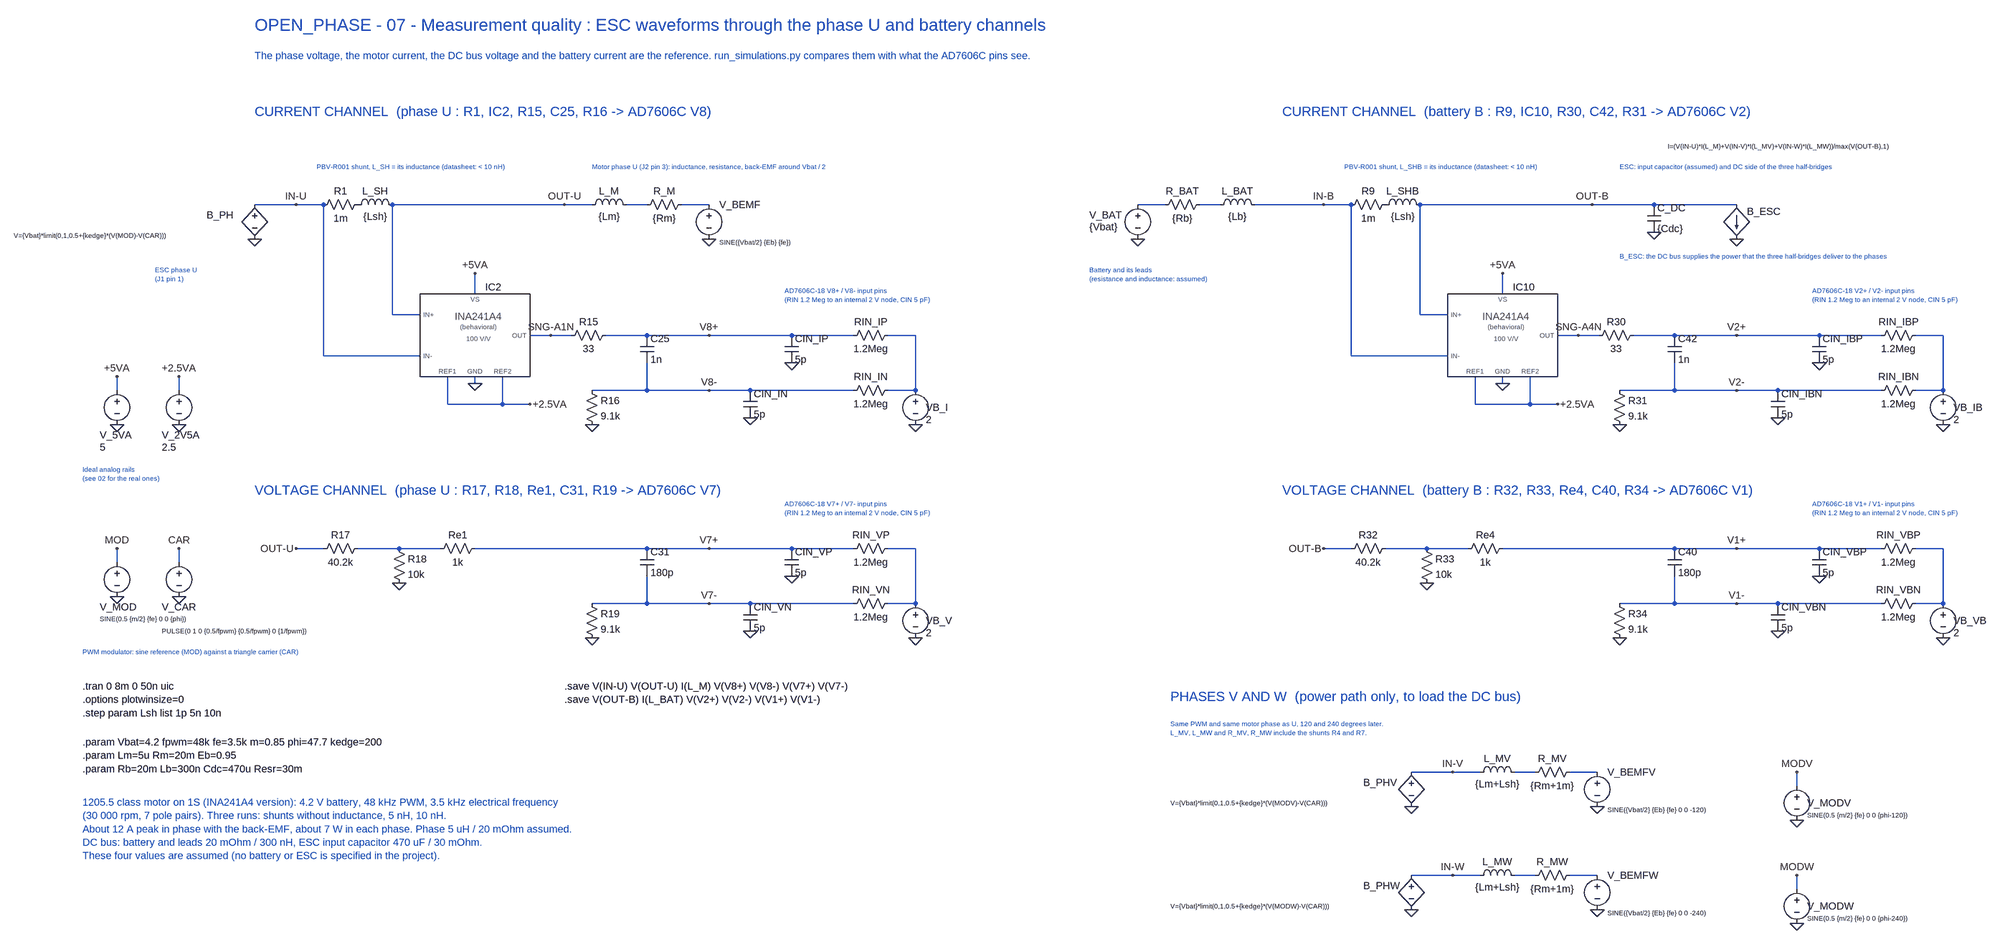
[diagram p0: schematic 07_Measurement_Quality_Waveforms.asc]
07_Measurement_Quality_Waveforms.asc, the LTspice schematic file:
Version 4
SHEET 1 4700 1900
WIRE 0 0 96 0
WIRE 96 0 160 0
WIRE 320 0 720 0
WIRE 720 0 784 0
WIRE 864 0 912 0
WIRE 992 0 1056 0
WIRE 320 0 320 256
WIRE 320 256 384 256
WIRE 160 0 160 352
WIRE 160 352 384 352
WIRE 512 208 512 160
WIRE 512 400 512 416
WIRE 448 400 448 464
WIRE 448 464 576 464
WIRE 576 464 576 400
WIRE 576 464 640 464
WIRE 640 304 688 304
WIRE 688 304 736 304
WIRE 912 368 912 432
WIRE 1472 304 1536 304
WIRE 1536 304 1536 432
WIRE 1472 432 1536 432
WIRE 816 304 912 304
WIRE 912 304 1056 304
WIRE 1056 304 1248 304
WIRE 1248 304 1392 304
WIRE 784 432 912 432
WIRE 912 432 1056 432
WIRE 1056 432 1152 432
WIRE 1152 432 1392 432
WIRE 96 800 160 800
WIRE 240 800 336 800
WIRE 336 800 432 800
WIRE 912 864 912 928
WIRE 1472 800 1536 800
WIRE 1536 800 1536 928
WIRE 1472 928 1536 928
WIRE 512 800 912 800
WIRE 912 800 1056 800
WIRE 1056 800 1248 800
WIRE 1248 800 1392 800
WIRE 784 928 912 928
WIRE 912 928 1056 928
WIRE 1056 928 1152 928
WIRE 1152 928 1392 928
WIRE -320 432 -320 400
WIRE -176 432 -176 400
WIRE 2464 0 2528 0
WIRE 2608 0 2656 0
WIRE 2736 0 2800 0
WIRE 2800 0 2896 0
WIRE 2896 0 2960 0
WIRE 3120 0 3520 0
WIRE 3520 0 3664 0
WIRE 3664 0 3856 0
WIRE 3120 0 3120 256
WIRE 3120 256 3184 256
WIRE 2960 0 2960 352
WIRE 2960 352 3184 352
WIRE 3312 208 3312 160
WIRE 3312 400 3312 416
WIRE 3248 400 3248 464
WIRE 3248 464 3376 464
WIRE 3376 464 3376 400
WIRE 3376 464 3440 464
WIRE 3440 304 3488 304
WIRE 3488 304 3536 304
WIRE 3712 368 3712 432
WIRE 4272 304 4336 304
WIRE 4336 304 4336 432
WIRE 4272 432 4336 432
WIRE 3616 304 3712 304
WIRE 3712 304 3856 304
WIRE 3856 304 4048 304
WIRE 4048 304 4192 304
WIRE 3584 432 3712 432
WIRE 3712 432 3856 432
WIRE 3856 432 3952 432
WIRE 3952 432 4192 432
WIRE 2896 800 2960 800
WIRE 3040 800 3136 800
WIRE 3136 800 3232 800
WIRE 3712 864 3712 928
WIRE 4272 800 4336 800
WIRE 4336 800 4336 928
WIRE 4272 928 4336 928
WIRE 3312 800 3712 800
WIRE 3712 800 3856 800
WIRE 3856 800 4048 800
WIRE 4048 800 4192 800
WIRE 3584 928 3712 928
WIRE 3712 928 3856 928
WIRE 3856 928 3952 928
WIRE 3952 928 4192 928
WIRE 3100 1320 3196 1320
WIRE 3196 1320 3260 1320
WIRE 3340 1320 3388 1320
WIRE 3468 1320 3532 1320
WIRE 3996 1352 3996 1320
WIRE 3100 1560 3196 1560
WIRE 3196 1560 3260 1560
WIRE 3340 1560 3388 1560
WIRE 3468 1560 3532 1560
WIRE 3996 1592 3996 1560
WIRE -320 832 -320 800
WIRE -176 832 -176 800
FLAG 0 80 0
FLAG 1056 80 0
FLAG 96 0 IN-U
FLAG 720 0 OUT-U
FLAG 512 160 +5VA
FLAG 512 416 0
FLAG 640 464 +2.5VA
FLAG 688 304 SNG-A1N
FLAG 784 512 0
FLAG 1536 512 0
FLAG 1248 368 0
FLAG 1152 496 0
FLAG 1056 304 V8+
FLAG 1056 432 V8-
FLAG 96 800 OUT-U
FLAG 336 880 0
FLAG 784 1008 0
FLAG 1536 1008 0
FLAG 1248 864 0
FLAG 1152 992 0
FLAG 1056 800 V7+
FLAG 1056 928 V7-
FLAG -320 400 +5VA
FLAG -320 512 0
FLAG -176 400 +2.5VA
FLAG -176 512 0
FLAG 2464 80 0
FLAG 3664 64 0
FLAG 3856 80 0
FLAG 2896 0 IN-B
FLAG 3520 0 OUT-B
FLAG 3312 160 +5VA
FLAG 3312 416 0
FLAG 3440 464 +2.5VA
FLAG 3488 304 SNG-A4N
FLAG 3584 512 0
FLAG 4336 512 0
FLAG 4048 368 0
FLAG 3952 496 0
FLAG 3856 304 V2+
FLAG 3856 432 V2-
FLAG 2896 800 OUT-B
FLAG 3136 880 0
FLAG 3584 1008 0
FLAG 4336 1008 0
FLAG 4048 864 0
FLAG 3952 992 0
FLAG 3856 800 V1+
FLAG 3856 928 V1-
FLAG 3100 1400 0
FLAG 3532 1400 0
FLAG 3196 1320 IN-V
FLAG 3996 1320 MODV
FLAG 3996 1432 0
FLAG 3100 1640 0
FLAG 3532 1640 0
FLAG 3196 1560 IN-W
FLAG 3996 1560 MODW
FLAG 3996 1672 0
FLAG -320 800 MOD
FLAG -320 912 0
FLAG -176 800 CAR
FLAG -176 912 0
SYMBOL bv 0 -16 R0
WINDOW 0 -112 40 Left 2
WINDOW 3 -560 88 Left 1
SYMATTR InstName B_PH
SYMATTR Value V={Vbat}*limit(0,1,0.5+{kedge}*(V(MOD)-V(CAR)))
SYMBOL res 144 16 R270
WINDOW 0 32 56 VTop 2
WINDOW 3 0 56 VBottom 2
SYMATTR InstName R1
SYMATTR Value 1m
SYMBOL ind 224 16 R270
WINDOW 0 32 56 VTop 2
WINDOW 3 4 56 VBottom 2
SYMATTR InstName L_SH
SYMATTR Value {Lsh}
SYMATTR SpiceLine Rser=0
SYMBOL ind 768 16 R270
WINDOW 0 32 56 VTop 2
WINDOW 3 4 56 VBottom 2
SYMATTR InstName L_M
SYMATTR Value {Lm}
SYMATTR SpiceLine Rser=0
SYMBOL res 896 16 R270
WINDOW 0 32 56 VTop 2
WINDOW 3 0 56 VBottom 2
SYMATTR InstName R_M
SYMATTR Value {Rm}
SYMBOL voltage 1056 -16 R0
WINDOW 0 24 16 Left 2
WINDOW 3 24 104 Left 1
SYMATTR InstName V_BEMF
SYMATTR Value SINE({Vbat/2} {Eb} {fe})
SYMBOL INA241A4_behav 512 304 R0
SYMATTR InstName IC2
SYMBOL res 720 320 R270
WINDOW 0 32 56 VTop 2
WINDOW 3 0 56 VBottom 2
SYMATTR InstName R15
SYMATTR Value 33
SYMBOL cap 896 304 R0
SYMATTR InstName C25
SYMATTR Value 1n
SYMBOL res 768 416 R0
SYMATTR InstName R16
SYMATTR Value 9.1k
SYMBOL res 1376 320 R270
WINDOW 0 32 56 VTop 2
WINDOW 3 0 56 VBottom 2
SYMATTR InstName RIN_IP
SYMATTR Value 1.2Meg
SYMBOL res 1376 448 R270
WINDOW 0 32 56 VTop 2
WINDOW 3 0 56 VBottom 2
SYMATTR InstName RIN_IN
SYMATTR Value 1.2Meg
SYMBOL voltage 1536 416 R0
WINDOW 0 24 56 Left 2
WINDOW 3 24 84 Left 2
SYMATTR InstName VB_I
SYMATTR Value 2
SYMBOL cap 1232 304 R0
SYMATTR InstName CIN_IP
SYMATTR Value 5p
SYMBOL cap 1136 432 R0
SYMATTR InstName CIN_IN
SYMATTR Value 5p
SYMBOL res 144 816 R270
WINDOW 0 32 56 VTop 2
WINDOW 3 0 56 VBottom 2
SYMATTR InstName R17
SYMATTR Value 40.2k
SYMBOL res 320 784 R0
SYMATTR InstName R18
SYMATTR Value 10k
SYMBOL res 416 816 R270
WINDOW 0 32 56 VTop 2
WINDOW 3 0 56 VBottom 2
SYMATTR InstName Re1
SYMATTR Value 1k
SYMBOL cap 896 800 R0
SYMATTR InstName C31
SYMATTR Value 180p
SYMBOL res 768 912 R0
SYMATTR InstName R19
SYMATTR Value 9.1k
SYMBOL res 1376 816 R270
WINDOW 0 32 56 VTop 2
WINDOW 3 0 56 VBottom 2
SYMATTR InstName RIN_VP
SYMATTR Value 1.2Meg
SYMBOL res 1376 944 R270
WINDOW 0 32 56 VTop 2
WINDOW 3 0 56 VBottom 2
SYMATTR InstName RIN_VN
SYMATTR Value 1.2Meg
SYMBOL voltage 1536 912 R0
WINDOW 0 24 56 Left 2
WINDOW 3 24 84 Left 2
SYMATTR InstName VB_V
SYMATTR Value 2
SYMBOL cap 1232 800 R0
SYMATTR InstName CIN_VP
SYMATTR Value 5p
SYMBOL cap 1136 928 R0
SYMATTR InstName CIN_VN
SYMATTR Value 5p
SYMBOL voltage -320 416 R0
WINDOW 0 -40 120 Left 2
WINDOW 3 -40 148 Left 2
SYMATTR InstName V_5VA
SYMATTR Value 5
SYMBOL voltage -176 416 R0
WINDOW 0 -40 120 Left 2
WINDOW 3 -40 148 Left 2
SYMATTR InstName V_2V5A
SYMATTR Value 2.5
SYMBOL voltage 2464 -16 R0
WINDOW 0 -112 40 Left 2
WINDOW 3 -112 68 Left 2
SYMATTR InstName V_BAT
SYMATTR Value {Vbat}
SYMBOL res 2512 16 R270
WINDOW 0 32 56 VTop 2
WINDOW 3 0 56 VBottom 2
SYMATTR InstName R_BAT
SYMATTR Value {Rb}
SYMBOL ind 2640 16 R270
WINDOW 0 32 56 VTop 2
WINDOW 3 4 56 VBottom 2
SYMATTR InstName L_BAT
SYMATTR Value {Lb}
SYMATTR SpiceLine Rser=0
SYMBOL res 2944 16 R270
WINDOW 0 32 56 VTop 2
WINDOW 3 0 56 VBottom 2
SYMATTR InstName R9
SYMATTR Value 1m
SYMBOL ind 3024 16 R270
WINDOW 0 32 56 VTop 2
WINDOW 3 4 56 VBottom 2
SYMATTR InstName L_SHB
SYMATTR Value {Lsh}
SYMATTR SpiceLine Rser=0
SYMBOL cap 3648 0 R0
SYMATTR InstName C_DC
SYMATTR Value {Cdc}
SYMATTR SpiceLine Rser={Resr} IC={Vbat}
SYMBOL bi 3856 0 R0
WINDOW 0 24 16 Left 2
WINDOW 3 -160 -136 Left 1
SYMATTR InstName B_ESC
SYMATTR Value I=(V(IN-U)*I(L_M)+V(IN-V)*I(L_MV)+V(IN-W)*I(L_MW))/max(V(OUT-B),1)
SYMBOL INA241A4_behav 3312 304 R0
SYMATTR InstName IC10
SYMBOL res 3520 320 R270
WINDOW 0 32 56 VTop 2
WINDOW 3 0 56 VBottom 2
SYMATTR InstName R30
SYMATTR Value 33
SYMBOL cap 3696 304 R0
SYMATTR InstName C42
SYMATTR Value 1n
SYMBOL res 3568 416 R0
SYMATTR InstName R31
SYMATTR Value 9.1k
SYMBOL res 4176 320 R270
WINDOW 0 32 56 VTop 2
WINDOW 3 0 56 VBottom 2
SYMATTR InstName RIN_IBP
SYMATTR Value 1.2Meg
SYMBOL res 4176 448 R270
WINDOW 0 32 56 VTop 2
WINDOW 3 0 56 VBottom 2
SYMATTR InstName RIN_IBN
SYMATTR Value 1.2Meg
SYMBOL voltage 4336 416 R0
WINDOW 0 24 56 Left 2
WINDOW 3 24 84 Left 2
SYMATTR InstName VB_IB
SYMATTR Value 2
SYMBOL cap 4032 304 R0
SYMATTR InstName CIN_IBP
SYMATTR Value 5p
SYMBOL cap 3936 432 R0
SYMATTR InstName CIN_IBN
SYMATTR Value 5p
SYMBOL res 2944 816 R270
WINDOW 0 32 56 VTop 2
WINDOW 3 0 56 VBottom 2
SYMATTR InstName R32
SYMATTR Value 40.2k
SYMBOL res 3120 784 R0
SYMATTR InstName R33
SYMATTR Value 10k
SYMBOL res 3216 816 R270
WINDOW 0 32 56 VTop 2
WINDOW 3 0 56 VBottom 2
SYMATTR InstName Re4
SYMATTR Value 1k
SYMBOL cap 3696 800 R0
SYMATTR InstName C40
SYMATTR Value 180p
SYMBOL res 3568 912 R0
SYMATTR InstName R34
SYMATTR Value 9.1k
SYMBOL res 4176 816 R270
WINDOW 0 32 56 VTop 2
WINDOW 3 0 56 VBottom 2
SYMATTR InstName RIN_VBP
SYMATTR Value 1.2Meg
SYMBOL res 4176 944 R270
WINDOW 0 32 56 VTop 2
WINDOW 3 0 56 VBottom 2
SYMATTR InstName RIN_VBN
SYMATTR Value 1.2Meg
SYMBOL voltage 4336 912 R0
WINDOW 0 24 56 Left 2
WINDOW 3 24 84 Left 2
SYMATTR InstName VB_VB
SYMATTR Value 2
SYMBOL cap 4032 800 R0
SYMATTR InstName CIN_VBP
SYMATTR Value 5p
SYMBOL cap 3936 928 R0
SYMATTR InstName CIN_VBN
SYMATTR Value 5p
SYMBOL bv 3100 1304 R0
WINDOW 0 -112 40 Left 2
WINDOW 3 -560 88 Left 1
SYMATTR InstName B_PHV
SYMATTR Value V={Vbat}*limit(0,1,0.5+{kedge}*(V(MODV)-V(CAR)))
SYMBOL ind 3244 1336 R270
WINDOW 0 32 56 VTop 2
WINDOW 3 4 56 VBottom 2
SYMATTR InstName L_MV
SYMATTR Value {Lm+Lsh}
SYMATTR SpiceLine Rser=0
SYMBOL res 3372 1336 R270
WINDOW 0 32 56 VTop 2
WINDOW 3 0 56 VBottom 2
SYMATTR InstName R_MV
SYMATTR Value {Rm+1m}
SYMBOL voltage 3532 1304 R0
WINDOW 0 24 16 Left 2
WINDOW 3 24 104 Left 1
SYMATTR InstName V_BEMFV
SYMATTR Value SINE({Vbat/2} {Eb} {fe} 0 0 -120)
SYMBOL voltage 3996 1336 R0
WINDOW 0 24 56 Left 2
WINDOW 3 24 84 Left 1
SYMATTR InstName V_MODV
SYMATTR Value SINE(0.5 {m/2} {fe} 0 0 {phi-120})
SYMBOL bv 3100 1544 R0
WINDOW 0 -112 40 Left 2
WINDOW 3 -560 88 Left 1
SYMATTR InstName B_PHW
SYMATTR Value V={Vbat}*limit(0,1,0.5+{kedge}*(V(MODW)-V(CAR)))
SYMBOL ind 3244 1576 R270
WINDOW 0 32 56 VTop 2
WINDOW 3 4 56 VBottom 2
SYMATTR InstName L_MW
SYMATTR Value {Lm+Lsh}
SYMATTR SpiceLine Rser=0
SYMBOL res 3372 1576 R270
WINDOW 0 32 56 VTop 2
WINDOW 3 0 56 VBottom 2
SYMATTR InstName R_MW
SYMATTR Value {Rm+1m}
SYMBOL voltage 3532 1544 R0
WINDOW 0 24 16 Left 2
WINDOW 3 24 104 Left 1
SYMATTR InstName V_BEMFW
SYMATTR Value SINE({Vbat/2} {Eb} {fe} 0 0 -240)
SYMBOL voltage 3996 1576 R0
WINDOW 0 24 56 Left 2
WINDOW 3 24 84 Left 1
SYMATTR InstName V_MODW
SYMATTR Value SINE(0.5 {m/2} {fe} 0 0 {phi-240})
SYMBOL voltage -320 816 R0
WINDOW 0 -40 120 Left 2
WINDOW 3 -40 148 Left 1
SYMATTR InstName V_MOD
SYMATTR Value SINE(0.5 {m/2} {fe} 0 0 {phi})
SYMBOL voltage -176 816 R0
WINDOW 0 -40 120 Left 2
WINDOW 3 -40 176 Left 1
SYMATTR InstName V_CAR
SYMATTR Value PULSE(0 1 0 {0.5/fpwm} {0.5/fpwm} 0 {1/fpwm})
TEXT 0 -448 Left 4 ;OPEN_PHASE - 07 - Measurement quality : ESC waveforms through the phase U and battery channels
TEXT 0 -376 Left 2 ;The phase voltage, the motor current, the DC bus voltage and the battery current are the reference. run_simulations.py compares them with what the AD7606C pins see.
TEXT -232 152 Left 1 ;ESC phase U\n(J1 pin 1)
TEXT 784 -88 Left 1 ;Motor phase U (J2 pin 3): inductance, resistance, back-EMF around Vbat / 2
TEXT 144 -88 Left 1 ;PBV-R001 shunt, L_SH = its inductance (datasheet: < 10 nH)
TEXT 1232 200 Left 1 ;AD7606C-18 V8+ / V8- input pins\n(RIN 1.2 Meg to an internal 2 V node, CIN 5 pF)
TEXT 0 -216 Left 3 ;CURRENT CHANNEL  (phase U : R1, IC2, R15, C25, R16 -> AD7606C V8)
TEXT 1232 696 Left 1 ;AD7606C-18 V7+ / V7- input pins\n(RIN 1.2 Meg to an internal 2 V node, CIN 5 pF)
TEXT 0 664 Left 3 ;VOLTAGE CHANNEL  (phase U : R17, R18, Re1, C31, R19 -> AD7606C V7)
TEXT -400 616 Left 1 ;Ideal analog rails\n(see 02 for the real ones)
TEXT 2352 152 Left 1 ;Battery and its leads\n(resistance and inductance: assumed)
TEXT 3584 -88 Left 1 ;ESC: input capacitor (assumed) and DC side of the three half-bridges
TEXT 2944 -88 Left 1 ;PBV-R001 shunt, L_SHB = its inductance (datasheet: < 10 nH)
TEXT 4032 200 Left 1 ;AD7606C-18 V2+ / V2- input pins\n(RIN 1.2 Meg to an internal 2 V node, CIN 5 pF)
TEXT 2800 -216 Left 3 ;CURRENT CHANNEL  (battery B : R9, IC10, R30, C42, R31 -> AD7606C V2)
TEXT 4032 696 Left 1 ;AD7606C-18 V1+ / V1- input pins\n(RIN 1.2 Meg to an internal 2 V node, CIN 5 pF)
TEXT 2800 664 Left 3 ;VOLTAGE CHANNEL  (battery B : R32, R33, Re4, C40, R34 -> AD7606C V1)
TEXT 3584 120 Left 1 ;B_ESC: the DC bus supplies the power that the three half-bridges deliver to the phases
TEXT 2540 1144 Left 3 ;PHASES V AND W  (power path only, to load the DC bus)
TEXT 2540 1208 Left 1 ;Same PWM and same motor phase as U, 120 and 240 degrees later.\nL_MV, L_MW and R_MV, R_MW include the shunts R4 and R7.
TEXT -400 1040 Left 1 ;PWM modulator: sine reference (MOD) against a triangle carrier (CAR)
TEXT -400 1120 Left 2 !.tran 0 8m 0 50n uic\n.options plotwinsize=0\n.step param Lsh list 1p 5n 10n
TEXT -400 1250 Left 2 !.param Vbat=4.2 fpwm=48k fe=3.5k m=0.85 phi=47.7 kedge=200\n.param Lm=5u Rm=20m Eb=0.95\n.param Rb=20m Lb=300n Cdc=470u Resr=30m
TEXT -400 1390 Left 2 ;1205.5 class motor on 1S (INA241A4 version): 4.2 V battery, 48 kHz PWM, 3.5 kHz electrical frequency\n(30 000 rpm, 7 pole pairs). Three runs: shunts without inductance, 5 nH, 10 nH.\nAbout 12 A peak in phase with the back-EMF, about 7 W in each phase. Phase 5 uH / 20 mOhm assumed.\nDC bus: battery and leads 20 mOhm / 300 nH, ESC input capacitor 470 uF / 30 mOhm.\nThese four values are assumed (no battery or ESC is specified in the project).
TEXT 720 1120 Left 2 !.save V(IN-U) V(OUT-U) I(L_M) V(V8+) V(V8-) V(V7+) V(V7-)\n.save V(OUT-B) I(L_BAT) V(V2+) V(V2-) V(V1+) V(V1-)

The netlist it stands for:
* 07_Measurement_Quality_Waveforms.asc
B_PH IN-U 0 V={Vbat}*limit(0,1,0.5+{kedge}*(V(MOD)-V(CAR)))
R1 IN-U P001 1m
L_SH P001 OUT-U {Lsh} Rser=0
L_M OUT-U N001 {Lm} Rser=0
R_M N001 N002 {Rm}
V_BEMF N002 0 SINE({Vbat/2} {Eb} {fe})
XIC2 OUT-U IN-U +2.5VA +2.5VA +5VA 0 SNG-A1N INA241A4_BEHAV  ; pins IN+ IN- REF1 REF2 VS GND OUT
R15 SNG-A1N V8+ 33
C25 V8+ V8- 1n
R16 V8- 0 9.1k
RIN_IP V8+ N003 1.2Meg
RIN_IN V8- N003 1.2Meg
VB_I N003 0 2
CIN_IP V8+ 0 5p
CIN_IN V8- 0 5p
R17 OUT-U N004 40.2k
R18 N004 0 10k
Re1 N004 V7+ 1k
C31 V7+ V7- 180p
R19 V7- 0 9.1k
RIN_VP V7+ N005 1.2Meg
RIN_VN V7- N005 1.2Meg
VB_V N005 0 2
CIN_VP V7+ 0 5p
CIN_VN V7- 0 5p
V_5VA +5VA 0 5
V_2V5A +2.5VA 0 2.5
V_BAT N006 0 {Vbat}
R_BAT N006 N007 {Rb}
L_BAT N007 IN-B {Lb} Rser=0
R9 IN-B P002 1m
L_SHB P002 OUT-B {Lsh} Rser=0
C_DC OUT-B 0 {Cdc} Rser={Resr} IC={Vbat}
B_ESC OUT-B 0 I=(V(IN-U)*I(L_M)+V(IN-V)*I(L_MV)+V(IN-W)*I(L_MW))/max(V(OUT-B),1)
XIC10 OUT-B IN-B +2.5VA +2.5VA +5VA 0 SNG-A4N INA241A4_BEHAV  ; pins IN+ IN- REF1 REF2 VS GND OUT
R30 SNG-A4N V2+ 33
C42 V2+ V2- 1n
R31 V2- 0 9.1k
RIN_IBP V2+ N008 1.2Meg
RIN_IBN V2- N008 1.2Meg
VB_IB N008 0 2
CIN_IBP V2+ 0 5p
CIN_IBN V2- 0 5p
R32 OUT-B N009 40.2k
R33 N009 0 10k
Re4 N009 V1+ 1k
C40 V1+ V1- 180p
R34 V1- 0 9.1k
RIN_VBP V1+ N010 1.2Meg
RIN_VBN V1- N010 1.2Meg
VB_VB N010 0 2
CIN_VBP V1+ 0 5p
CIN_VBN V1- 0 5p
B_PHV IN-V 0 V={Vbat}*limit(0,1,0.5+{kedge}*(V(MODV)-V(CAR)))
L_MV IN-V N011 {Lm+Lsh} Rser=0
R_MV N011 N012 {Rm+1m}
V_BEMFV N012 0 SINE({Vbat/2} {Eb} {fe} 0 0 -120)
V_MODV MODV 0 SINE(0.5 {m/2} {fe} 0 0 {phi-120})
B_PHW IN-W 0 V={Vbat}*limit(0,1,0.5+{kedge}*(V(MODW)-V(CAR)))
L_MW IN-W N013 {Lm+Lsh} Rser=0
R_MW N013 N014 {Rm+1m}
V_BEMFW N014 0 SINE({Vbat/2} {Eb} {fe} 0 0 -240)
V_MODW MODW 0 SINE(0.5 {m/2} {fe} 0 0 {phi-240})
V_MOD MOD 0 SINE(0.5 {m/2} {fe} 0 0 {phi})
V_CAR CAR 0 PULSE(0 1 0 {0.5/fpwm} {0.5/fpwm} 0 {1/fpwm})
* OPEN_PHASE - 07 - Measurement quality : ESC waveforms through the phase U and battery channels
* The phase voltage, the motor current, the DC bus voltage and the battery current are the reference. run_simulations.py compares them with what the AD7606C pins see.
* ESC phase U
* (J1 pin 1)
* Motor phase U (J2 pin 3): inductance, resistance, back-EMF around Vbat / 2
* PBV-R001 shunt, L_SH = its inductance (datasheet: < 10 nH)
* AD7606C-18 V8+ / V8- input pins
* (RIN 1.2 Meg to an internal 2 V node, CIN 5 pF)
* CURRENT CHANNEL  (phase U : R1, IC2, R15, C25, R16 -> AD7606C V8)
* AD7606C-18 V7+ / V7- input pins
* (RIN 1.2 Meg to an internal 2 V node, CIN 5 pF)
* VOLTAGE CHANNEL  (phase U : R17, R18, Re1, C31, R19 -> AD7606C V7)
* Ideal analog rails
* (see 02 for the real ones)
* Battery and its leads
* (resistance and inductance: assumed)
* ESC: input capacitor (assumed) and DC side of the three half-bridges
* PBV-R001 shunt, L_SHB = its inductance (datasheet: < 10 nH)
* AD7606C-18 V2+ / V2- input pins
* (RIN 1.2 Meg to an internal 2 V node, CIN 5 pF)
* CURRENT CHANNEL  (battery B : R9, IC10, R30, C42, R31 -> AD7606C V2)
* AD7606C-18 V1+ / V1- input pins
* (RIN 1.2 Meg to an internal 2 V node, CIN 5 pF)
* VOLTAGE CHANNEL  (battery B : R32, R33, Re4, C40, R34 -> AD7606C V1)
* B_ESC: the DC bus supplies the power that the three half-bridges deliver to the phases
* PHASES V AND W  (power path only, to load the DC bus)
* Same PWM and same motor phase as U, 120 and 240 degrees later.
* L_MV, L_MW and R_MV, R_MW include the shunts R4 and R7.
* PWM modulator: sine reference (MOD) against a triangle carrier (CAR)
.tran 0 8m 0 50n uic
.options plotwinsize=0
.step param Lsh list 1p 5n 10n
.param Vbat=4.2 fpwm=48k fe=3.5k m=0.85 phi=47.7 kedge=200
.param Lm=5u Rm=20m Eb=0.95
.param Rb=20m Lb=300n Cdc=470u Resr=30m
* 1205.5 class motor on 1S (INA241A4 version): 4.2 V battery, 48 kHz PWM, 3.5 kHz electrical frequency
* (30 000 rpm, 7 pole pairs). Three runs: shunts without inductance, 5 nH, 10 nH.
* About 12 A peak in phase with the back-EMF, about 7 W in each phase. Phase 5 uH / 20 mOhm assumed.
* DC bus: battery and leads 20 mOhm / 300 nH, ESC input capacitor 470 uF / 30 mOhm.
* These four values are assumed (no battery or ESC is specified in the project).
.save V(IN-U) V(OUT-U) I(L_M) V(V8+) V(V8-) V(V7+) V(V7-)
.save V(OUT-B) I(L_BAT) V(V2+) V(V2-) V(V1+) V(V1-)
.lib INA241A4_behav.sub
.backanno
.end